# Altium project EMC2026_v2.PrjPCB
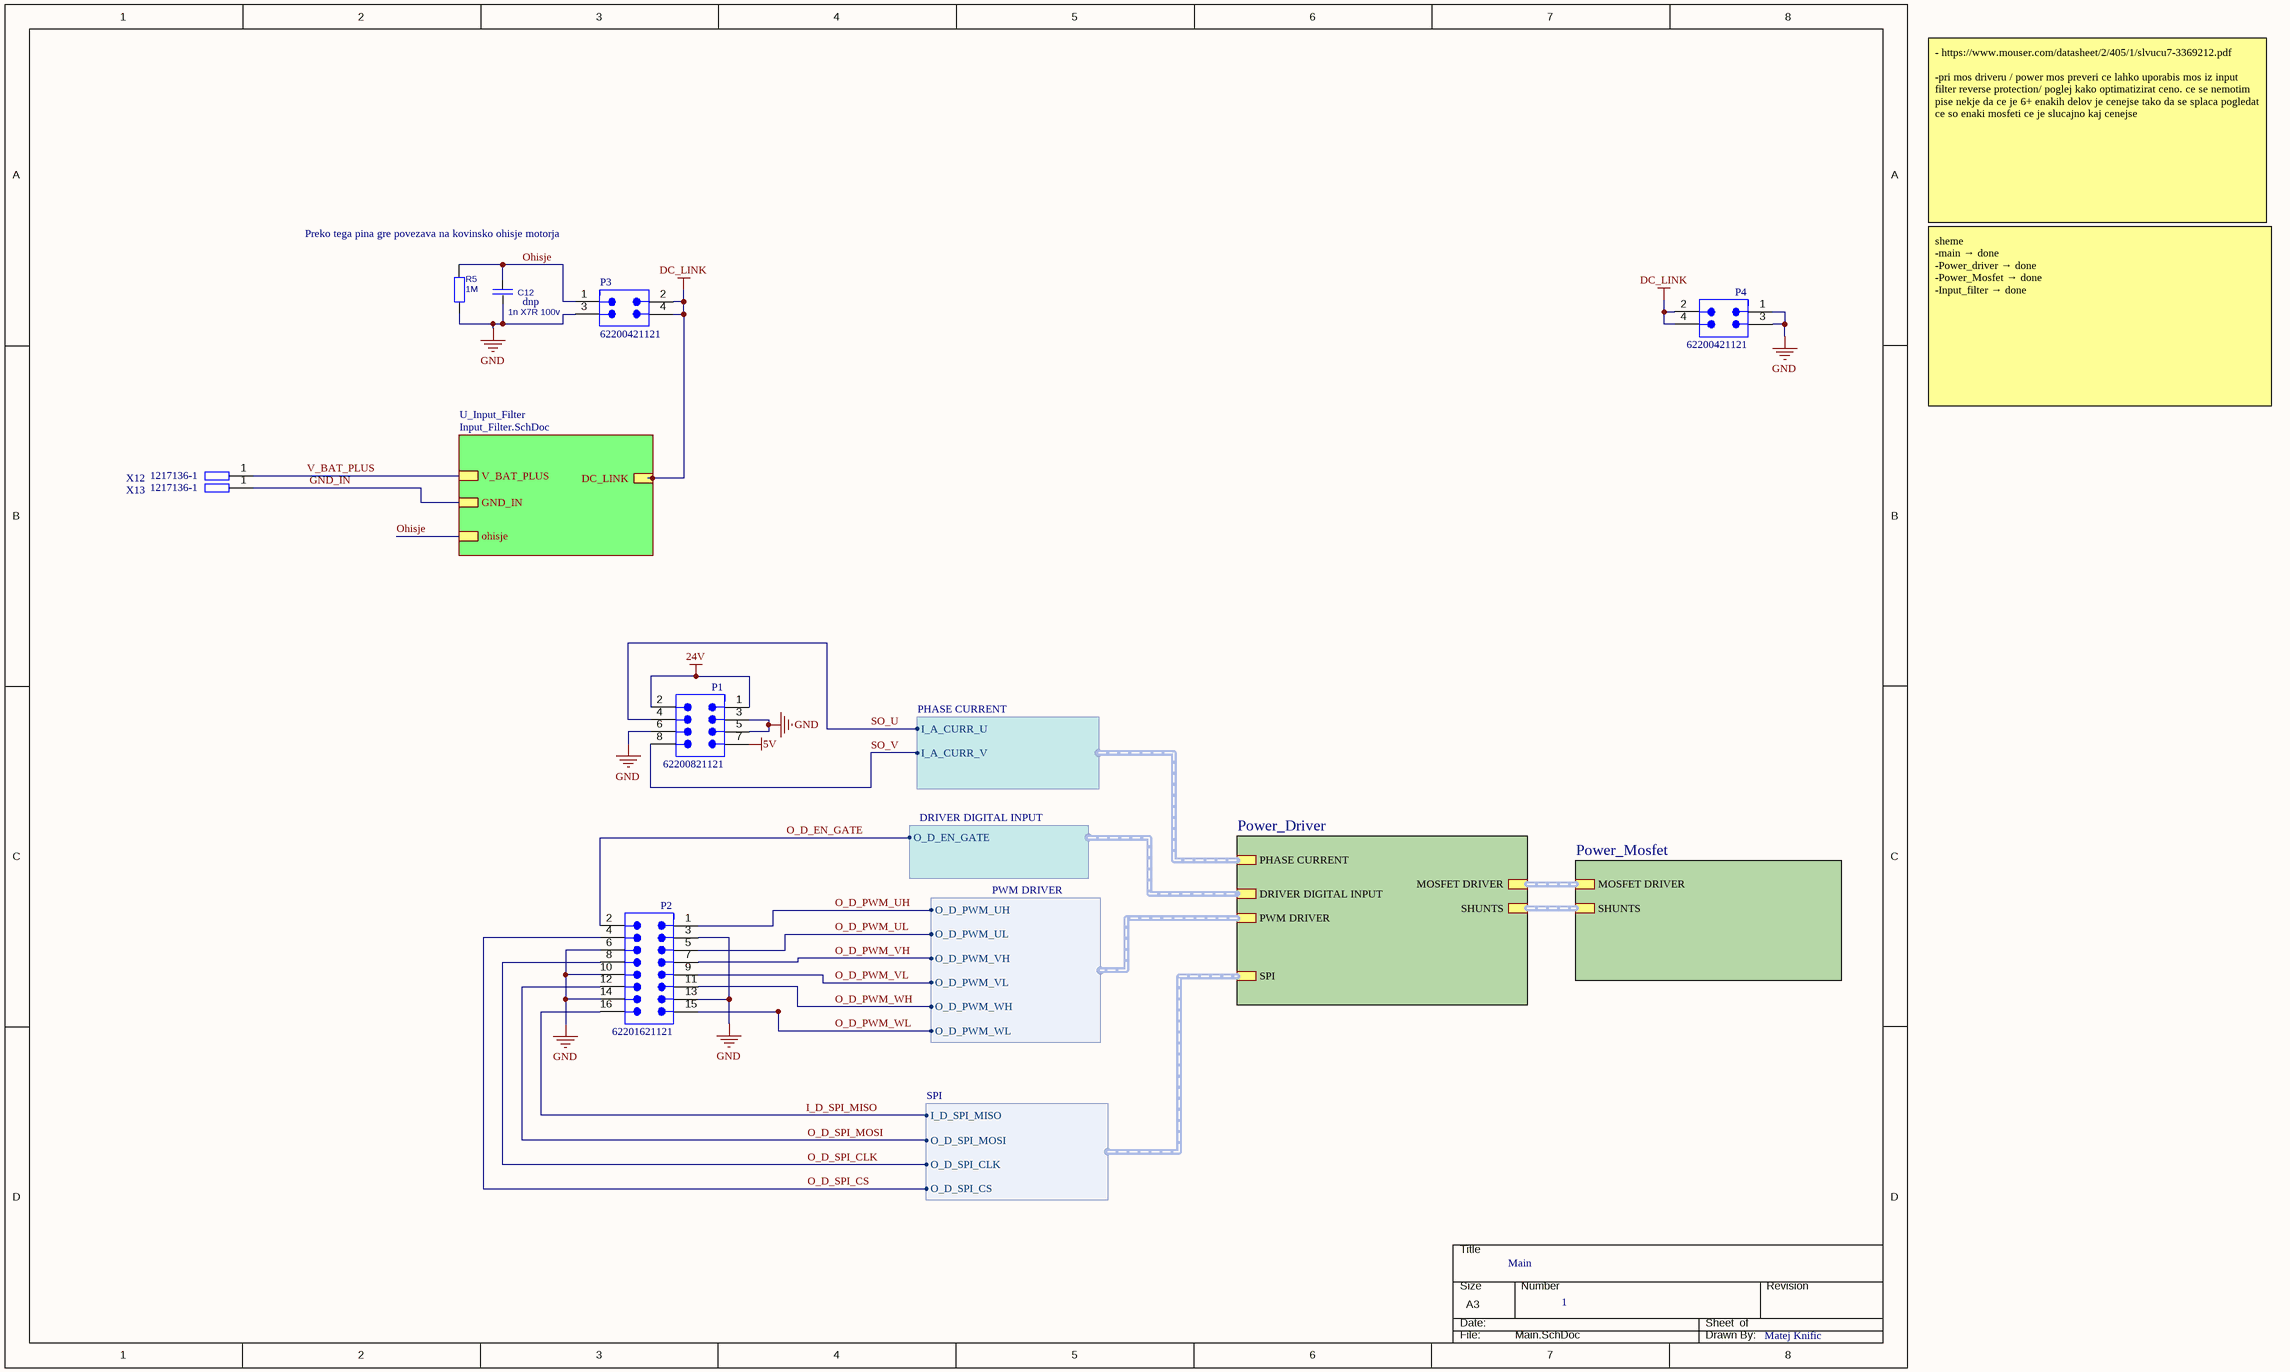
[diagram p0: Main.SchDoc]
Created: Luka Kavčič; PCB_ECN: /; PCB_ID: EMC2026; PCB_Material: FR4; PCB_Rev: 04; PCB_SAP_ID: ******; PCB_SAP_Name: VEZJE TISKANO EMC2026; PCB_Status: in progress
4 sheets, 91 parts. Net scope: hierarchical (ports join the sheet entries above them; power ports are global).
Board file: PCB_top.PcbDoc
Sheets:
  Main.SchDoc
    Power_Driver = Power_Driver.SchDoc
    Power_Mosfet = Power_Mosfet.SchDoc
    U_Input_Filter = Input_Filter.SchDoc

## Sheet Main.SchDoc
size A3; ApprovedBy: Franci Lahajnar; CheckedBy: Franci Lahajnar; Author: Ciril Močnik; DrawnBy: Ciril Močnik; Engineer: Franci Lahajnar; DocumentNumber: 1; SheetNumber: 1; SheetTotal: 12; PageSetup: Record=PageOptions|CenterHorizontal=True|CenterVertical=True|PrintScale=0.96|XCorrection=1.00|YCorrection=1.00|PrintKind=0|BorderSize=5000000|LeftOffset=0|BottomOffset=0|Orientation=2|PaperLength=1000|PaperWidth=1000|Scale=100|PaperSource=7|PrintQuality=600|MediaType=1|DitherType=10|PrintScaleMode=1|PaperKind=A4 210 x 297 mm; Sklop: SCHEMATIC; TipDok: SCHEMATIC; ModifiedDate: 2.10.2018

### Parts
C12  Parameter 1: dnp  [C0603]  (hidden comment: 1n X7R 100v)
P1  62200821121  [62200821121]
P2  62201621121  [62201621121]
P3  62200421121  [62200421121]
P4  62200421121  [62200421121]
R5  1M  [R0603]
X12  Manufacturer code: 1217136-1  [FPR_TAB_6.3_P5.08_Pokončni]  (hidden comment: C_TE_FASTON_6.3_P5.08)
X13  Manufacturer code: 1217136-1  [FPR_TAB_6.3_P5.08_Pokončni]  (hidden comment: C_TE_FASTON_6.3_P5.08)

### Sub-sheets
Power_Driver = Power_Driver.SchDoc: MOSFET DRIVER (harness MOSFET DRIVER), DRIVER DIGITAL INPUT (harness DRIVER DIGITAL INPUT), SPI (harness SPI), PHASE CURRENT (harness PHASE CURRENT), SHUNTS (harness SHUNTS), PWM DRIVER (harness PWM DRIVER)
Power_Mosfet = Power_Mosfet.SchDoc: MOSFET DRIVER (harness MOSFET DRIVER), SHUNTS (harness Shunts)
U_Input_Filter = Input_Filter.SchDoc: V_BAT_PLUS, DC_LINK, GND_IN, ohisje

### Harnesses
SPI: I_D_SPI_MISO, O_D_SPI_CLK, O_D_SPI_CS, O_D_SPI_MOSI
PWM DRIVER: O_D_PWM_UH, O_D_PWM_UL, O_D_PWM_VH, O_D_PWM_VL, O_D_PWM_WH, O_D_PWM_WL
DRIVER DIGITAL INPUT: O_D_EN_GATE
PHASE CURRENT: I_A_CURR_U, I_A_CURR_V

### Nets
5V: P1.7
24V: P1.1 P1.2
DC_LINK: P3.2 P3.4 P4.2 P4.4 ; sheet U_Input_Filter/DC_LINK
GND: C12.2 P1.3 P1.5 P1.6 P2.3 P2.6 P2.10 P2.13 P2.14 P3.3 P4.1 P4.3 R5.1
GND_IN: X13.1 ; sheet U_Input_Filter/GND_IN
I_D_SPI_MISO: P2.16 ; sheet Power_Driver/SPI.I_D_SPI_MISO
O_D_EN_GATE: P2.2 ; sheet Power_Driver/DRIVER DIGITAL INPUT.O_D_EN_GATE
O_D_PWM_UH: P2.1 ; sheet Power_Driver/PWM DRIVER.O_D_PWM_UH
O_D_PWM_UL: P2.5 ; sheet Power_Driver/PWM DRIVER.O_D_PWM_UL
O_D_PWM_VH: P2.7 ; sheet Power_Driver/PWM DRIVER.O_D_PWM_VH
O_D_PWM_VL: P2.9 ; sheet Power_Driver/PWM DRIVER.O_D_PWM_VL
O_D_PWM_WH: P2.11 ; sheet Power_Driver/PWM DRIVER.O_D_PWM_WH
O_D_PWM_WL: P2.15 ; sheet Power_Driver/PWM DRIVER.O_D_PWM_WL
O_D_SPI_CLK: P2.8 ; sheet Power_Driver/SPI.O_D_SPI_CLK
O_D_SPI_CS: P2.4 ; sheet Power_Driver/SPI.O_D_SPI_CS
O_D_SPI_MOSI: P2.12 ; sheet Power_Driver/SPI.O_D_SPI_MOSI
Ohisje: C12.1 P3.1 R5.2 ; sheet U_Input_Filter/ohisje
SO_U: P1.4 ; sheet Power_Driver/PHASE CURRENT.I_A_CURR_U
SO_V: P1.8 ; sheet Power_Driver/PHASE CURRENT.I_A_CURR_V
V_BAT_PLUS: X12.1 ; sheet U_Input_Filter/V_BAT_PLUS

### Buses and harness runs
harness sheet Power_Driver/MOSFET DRIVER = sheet Power_Mosfet/MOSFET DRIVER
harness sheet Power_Driver/SHUNTS = sheet Power_Mosfet/SHUNTS

### Notes on the sheet
- - https://www.mouser.com/datasheet/2/405/1/slvucu7-3369212.pdf
  -pri mos driveru / power mos preveri ce lahko uporabis mos iz input filter reverse protection/ poglej kako optimatizirat ceno. ce se nemotim pise nekje da ce je 6+ enakih delov je cenejse tako da se splaca pogledat ce so enaki mosfeti ce je slucajno kaj cenejse
- Preko tega pina gre povezava na kovinsko ohisje motorja
- sheme
  -main → done
  -Power_driver → done
  -Power_Mosfet → done
  -Input_filter → done
- Main
- Matej Knific
- THIS DOCUMENT AND THE DATA DISCLOSED HEREIN OR
- HEREWITH IS THE PROPERTY OF ALTIUM LIMITED AND MAY
- DWG NO:
- REVISION
- REV:
- DESCRIPTION
- DATE
- APPROVED
- BE FREELY DISTRIBUTED IN WHOLE. NO RIGHTS ARE
- RESERVED OR EXPRESS OR IMPLIED WARANTEE GIVEN.
- ENG:
- APPROVALS
- PROJECT
- DSN:
- CHK:
- REFERENCE DOCUMENTS
- PROJECT REVISION:
- TITLE
- DOCUMENT REVISION:
- DESIGN ITEM:
- BOM:
- FAB DWG:
- PCB DWG:
- ASSY DWG:
- SCALE:
- A3
- SIZE
- CAGE CODE
- FILE NAME
- DWG NO.
- SHEET
- OF
- REV

### Library data of the parts
C12 = C: Capacitor; Value: 1n X7R 100v
P1 = CMP-1502-00947-4: THT Vertical Pin Header WR-PHD, Pitch 1.27 mm, Dual Row, 8 pins; System: Connector; Row Spacing: 1.27mm; Connector Type: Male Pin; Contact Resistance: 20mΩ; Number of Contacts: 8; Current Rating: 1A; Gender: Male; Contact Plating: Gold; Packaging: Box; Termination: Solder; Number of Pins: 8; Lead Pitch: 1.27mm; Contact Material: Copper; Pitch: 1.27mm; Contact Mating Length: 3.81mm; Number of Rows: 2; RoHS: Compliant; Orientation: Vertical; Color: Black; Mount: Through Hole; Number of Positions: 8
P2 = CMP-1502-00950-4: THT Vertical Pin Header WR-PHD, Pitch 1.27 mm, Dual Row, 16 pins; Number of Positions: 16; Pitch: 1.27mm; Connector Type: Male Pin; Gender: Male; Current Rating: 1A; Contact Resistance: 20mΩ; System: Connector; RoHS: Compliant; Number of Rows: 2; Lead Pitch: 1.27mm; Contact Mating Length: 3.81mm; Row Spacing: 1.27mm; Mount: Through Hole; Number of Contacts: 16; Color: Black; Contact Material: Copper; Termination: Solder; Number of Pins: 16; Orientation: Vertical; Packaging: Box; Contact Plating: Gold
P3 P4 = CMP-1502-00946-4: THT Vertical Pin Header WR-PHD, Pitch 1.27 mm, Dual Row, 4 pins; Row Spacing: 1.27mm; Gender: Male; Number of Positions: 4; Contact Resistance: 20mΩ; Current Rating: 1A; System: Connector; Connector Type: Male Pin; Pitch: 1.27mm; Termination: Solder; Packaging: Box; Contact Mating Length: 3.81mm; Number of Pins: 4; Color: Black; Number of Contacts: 4; Contact Material: Copper; Orientation: Vertical; RoHS: Compliant; Mount: Through Hole; Lead Pitch: 1.27mm; Contact Plating: Gold; Number of Rows: 2
R5 = R: Value: 1M
X12 X13 = C_TE_FASTON_6.3_P5.08-4: FASTON 6.3 P5.08 Pokončni; Manufacturer: TE CONNECTIVITY; Voltage: /; SAP Ident: 1163972; SAP Name: KONEKTOR 1217136-1 TEC; BS: BS1552; AEC: No; Class: 15526; PinCount: 1; Datasheet: -; ROHS: 2011/65/EU; Mount: THT; REACH: 21.1.2025; TemperatureGrade: -30...110 °C; Current: -; HRVal: 1217136-1; Housing: 6.3x0.8mm; UL: /; MSL: 1

## Sheet Power_Driver.SchDoc
size A3; CheckedBy: Franci Lahajnar; DrawnBy: Ciril Močnik; DocumentNumber: 5; SheetNumber: 5; SheetTotal: 12; PageSetup: Record=PageOptions|CenterHorizontal=True|CenterVertical=True|PrintScale=0.96|XCorrection=1.00|YCorrection=1.00|PrintKind=0|BorderSize=5000000|LeftOffset=0|BottomOffset=0|Orientation=2|PaperLength=1000|PaperWidth=1000|Scale=100|PaperSource=7|PrintQuality=600|MediaType=1|DitherType=10|PaperKind=A4 210 x 297 mm|PrintScaleMode=1; Sklop: POWER DRIVER; TipDok: SCHEMATIC
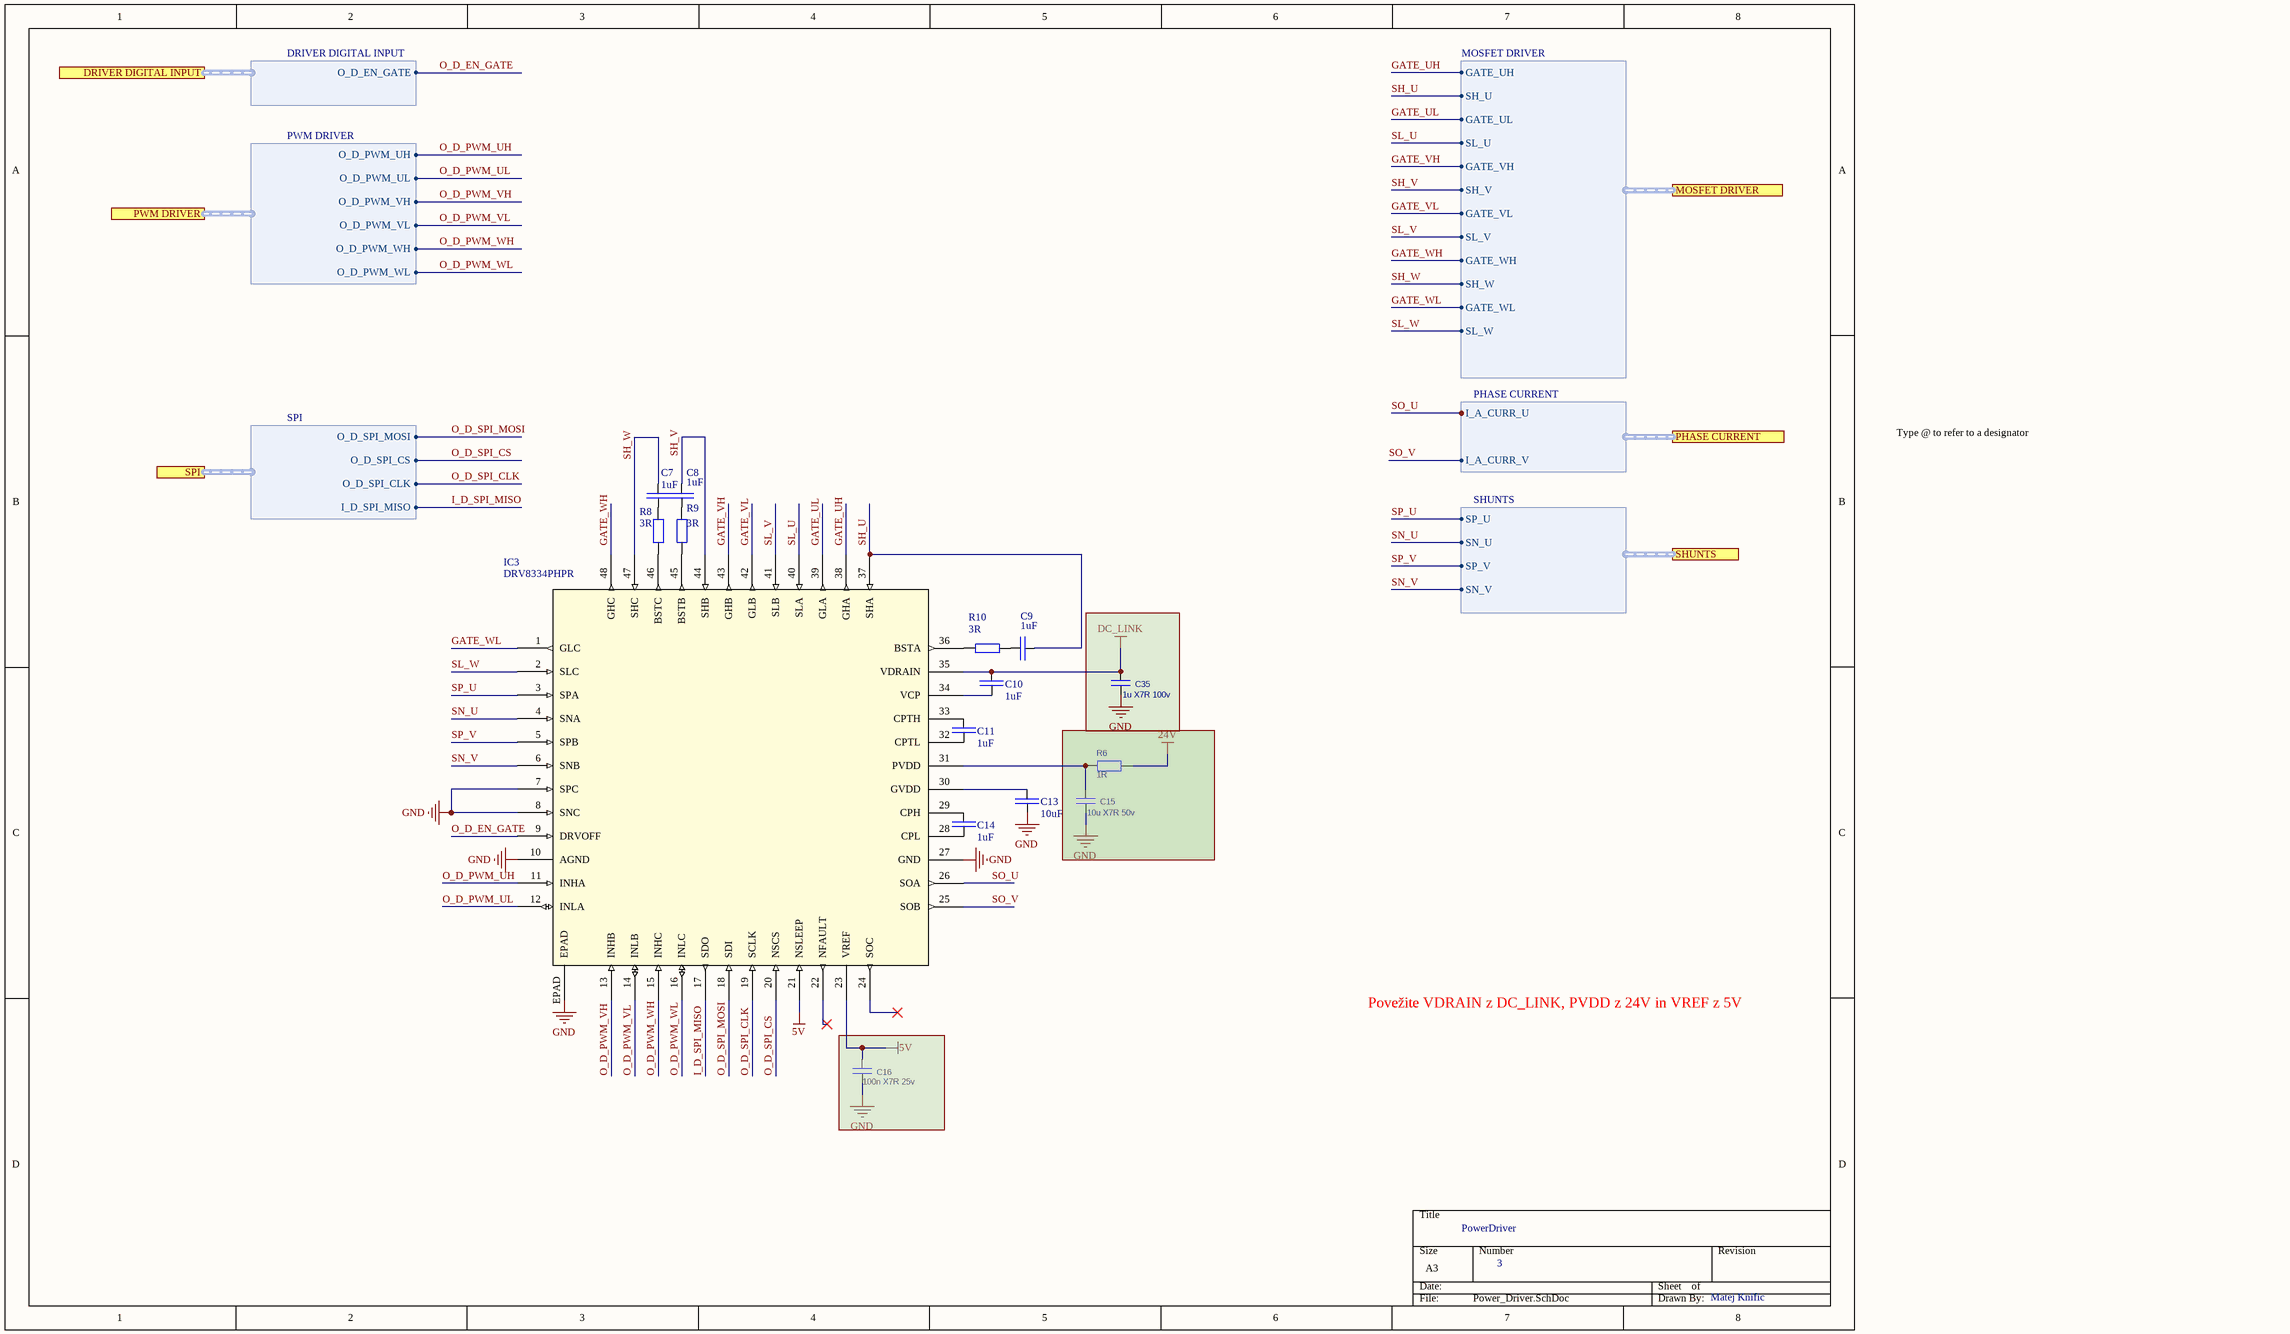
[diagram p1: Power_Driver.SchDoc]

### Parts
C7  HRVal: 1uF  [FPR_0805_C_R0_1]  (hidden comment: C_S_0805_1u_X7R_5)
C8  HRVal: 1uF  [FPR_0805_C_R0_1]  (hidden comment: C_S_0805_1u_X7R_5)
C9  HRVal: 1uF  [FPR_0805_C_R0_1]  (hidden comment: C_S_0805_1u_X7R_5)
C10  HRVal: 1uF  [FPR_0805_C_R0_1]  (hidden comment: C_S_0805_1u_X7R_5)
C11  HRVal: 1uF  [FPR_0805_C_R0_1]  (hidden comment: C_S_0805_1u_X7R_5)
C13  HRVal: 10uF  [FPR_1210_C_R0_10u]  (hidden comment: C_S_1210_10u_X7R_6)
C14  HRVal: 1uF  [FPR_0805_C_R0_1]  (hidden comment: C_S_0805_1u_X7R_5)
C15  10u X7R 50v  [RCL1210]
C16  100n X7R 25v  [C0603]
C35  1u X7R 100v  [RCL1210]
IC3  Manufacturer code: DRV8334PHPR  [FPR_HTQFP_48P]  (hidden comment: IC_D_DRV8334PHPR)
R6  1R  [R0603]
R8  HRVal: 3R  [FPR_0603_R_R0_1]  (hidden comment: R_L_0603_3R_1%_1)
R9  HRVal: 3R  [FPR_0603_R_R0_1]  (hidden comment: R_L_0603_3R_1%_1)
R10  HRVal: 3R  [FPR_0603_R_R0_1]  (hidden comment: R_L_0603_3R_1%_1)

### Ports
DRIVER DIGITAL INPUT (harness DRIVER DIGITAL INPUT), MOSFET DRIVER (harness MOSFET DRIVER), PHASE CURRENT (harness PHASE CURRENT), PWM DRIVER (harness PWM DRIVER), SHUNTS (harness SHUNTS), SPI (harness SPI)

### Harnesses
DRIVER DIGITAL INPUT: O_D_EN_GATE
PWM DRIVER: O_D_PWM_UH, O_D_PWM_UL, O_D_PWM_VH, O_D_PWM_VL, O_D_PWM_WH, O_D_PWM_WL
SPI: I_D_SPI_MISO, O_D_SPI_CLK, O_D_SPI_CS, O_D_SPI_MOSI
MOSFET DRIVER: GATE_UH, GATE_UL, GATE_VH, GATE_VL, GATE_WH, GATE_WL, SH_U, SH_V, SH_W, SL_U, SL_V, SL_W
PHASE CURRENT: I_A_CURR_U, I_A_CURR_V
SHUNTS: SP_U, SN_U, SP_V, SN_V

### Nets
5V: C16.1 IC3.21(NSLEEP) IC3.23(VREF)
24V: R6.1
DC_LINK: C10.1 C35.1 IC3.35(VDRAIN)
GND: C13.1 C15.2 C16.2 C35.2 IC3.7(SPC) IC3.8(SNC) IC3.10(AGND) IC3.27(GND) IC3.EPAD
GATE_UH: IC3.38(GHA) ; port MOSFET DRIVER.GATE_UH
GATE_UL: IC3.39(GLA) ; port MOSFET DRIVER.GATE_UL
GATE_VH: IC3.43(GHB) ; port MOSFET DRIVER.GATE_VH
GATE_VL: IC3.42(GLB) ; port MOSFET DRIVER.GATE_VL
GATE_WH: IC3.48(GHC) ; port MOSFET DRIVER.GATE_WH
GATE_WL: IC3.1(GLC) ; port MOSFET DRIVER.GATE_WL
I_D_SPI_MISO: IC3.17(SDO) ; port SPI.I_D_SPI_MISO
O_D_EN_GATE: IC3.9(DRVOFF) ; port DRIVER DIGITAL INPUT.O_D_EN_GATE
O_D_PWM_UH: IC3.11(INHA) ; port PWM DRIVER.O_D_PWM_UH
O_D_PWM_UL: IC3.12(INLA) ; port PWM DRIVER.O_D_PWM_UL
O_D_PWM_VH: IC3.13(INHB) ; port PWM DRIVER.O_D_PWM_VH
O_D_PWM_VL: IC3.14(INLB) ; port PWM DRIVER.O_D_PWM_VL
O_D_PWM_WH: IC3.15(INHC) ; port PWM DRIVER.O_D_PWM_WH
O_D_PWM_WL: IC3.16(INLC) ; port PWM DRIVER.O_D_PWM_WL
O_D_SPI_CLK: IC3.19(SCLK) ; port SPI.O_D_SPI_CLK
O_D_SPI_CS: IC3.20(NSCS) ; port SPI.O_D_SPI_CS
O_D_SPI_MOSI: IC3.18(SDI) ; port SPI.O_D_SPI_MOSI
SH_U: C9.2 IC3.37(SHA) ; port MOSFET DRIVER.SH_U
SH_V: C8.2 IC3.44(SHB) ; port MOSFET DRIVER.SH_V
SH_W: C7.2 IC3.47(SHC) ; port MOSFET DRIVER.SH_W
SL_U: IC3.40(SLA) ; port MOSFET DRIVER.SL_U
SL_V: IC3.41(SLB) ; port MOSFET DRIVER.SL_V
SL_W: IC3.2(SLC) ; port MOSFET DRIVER.SL_W
SN_U: IC3.4(SNA) ; port SHUNTS.SN_U
SN_V: IC3.6(SNB) ; port SHUNTS.SN_V
SO_U: IC3.26(SOA) ; port PHASE CURRENT.I_A_CURR_U
SO_V: IC3.25(SOB) ; port PHASE CURRENT.I_A_CURR_V
SP_U: IC3.3(SPA) ; port SHUNTS.SP_U
SP_V: IC3.5(SPB) ; port SHUNTS.SP_V
NetC7_1: C7.1 R8.2
NetC8_1: C8.1 R9.2
NetC9_1: C9.1 R10.2
NetC10_2: C10.2 IC3.34(VCP)
NetC11_1: C11.1 IC3.33(CPTH)
NetC11_2: C11.2 IC3.32(CPTL)
NetC13_2: C13.2 IC3.30(GVDD)
NetC14_1: C14.1 IC3.29(CPH)
NetC14_2: C14.2 IC3.28(CPL)
NetC15_1: C15.1 IC3.31(PVDD) R6.2
NetIC3_36: IC3.36(BSTA) R10.1
NetIC3_45: IC3.45(BSTB) R9.1
NetIC3_46: IC3.46(BSTC) R8.1

Not connected (* = marked no-connect by the designer): IC3 22(NFAULT)* 24(SOC)*

### Notes on the sheet
- Type @ to refer to a designator
- Povežite VDRAIN z DC_LINK, PVDD z 24V in VREF z 5V
- PowerDriver
- 3
- Matej Knific
- Kolektor Group d.o.o.
- KOLEKTOR
- GROUP
- Datum:
- Konst.:
- Naziv
- Sklop
- ECN
- SAP ID
- Rev.:
- List:
- Vojkova 10, p.p. 85
- SI-5280 Idrija , Slovenija
- Koda
- Datoteka:

### Library data of the parts
C7-C11 C14 = C_S_0805_1u_X7R_5-3: Single capacitor 1uF 10% soft-term AEC200; Manufacturer: Murata; Manufacturer code: GCJ21BR71H105KA01L; SAP Name: KONDENZATOR GCJ21BR71H105KA01L MUR; BS: BS1556; Tolerance: 10; Value [F]: 1e-6; Voltage: 50; SAP Ident: 927197; Class: 15562; Mount: SMD; ROHS: 2011/65/EU; Datasheet: https://www.murata.com/~/media/webrenewal/support/library/catalog/products/capacitor/mlcc/c03e.ashx; TemperatureGrade: -55...125; Housing: 0805; AEC: 21.8.2019; REACH: 20.6.2016; UL: -; MSL: 1
C13 = C_S_1210_10u_X7R_6-4: Single capacitor 10uF; Manufacturer: AVX; Manufacturer code: 12105C106K4Z4A; BS: BS1556; SAP Name: KONDENZATOR 12105C106K4Z4A AVX; Tolerance: 10; Value [F]: 10e-6; Voltage: 50; SAP Ident: 919177; Class: 15562; Shelf life: 12 months; ROHS: 2011/65/EU; AEC: 3.6.2019; TemperatureGrade: -55...125; MSL: /; UL: -; Housing: 1210; Datasheet: /; Mount: SMD; REACH: 15.1.2019
C15 C16 C35 = C: Capacitor
  C15: Value: 10u X7R 50v
  C16: Value: 100n X7R 25v
  C35: Value: 1u X7R 100v
IC3 = IC_D_DRV8334PHPR-3: Three phase MOSFET driver; Manufacturer: TI; AEC: No; BS: BS1557; Class: 15571; Output Current: 1000 / 2000 mA; Output Voltage: 60; SAP Ident: 1125019; SAP Name: GONILNIK DRV8334PHPR TI; Datasheet: /; Housing: HTQFP; HRVal: DRV8334PHPR; Mount: SMD; REACH: 23.07.2024; ROHS: 2011/65/EU; TemperatureGrade: -40...125; UL: -; MSL: 1
R6 = R: Value: 1R
R8-R10 = R_L_0603_3R_1%_1-3: Upor 3R 0603 1% 100mW; Manufacturer code: CRCW06033R00FKEA; Manufacturer: VISHAY; SAP Name: UPOR CRCW06033R00FKEA VIS; Tolerance: 1; Power: 100e-3; ReleaseDateNum: 45455.4806185648; BS: BS1556; Class: 15561; Value [Ohm]: 3; SAP Ident: 1125027; Housing: 0603; TemperatureGrade: -55...155; Mount: SMD; ROHS: 2015/863/EU; Datasheet: https://www.vishay.com/docs/20035/dcrcwe3.pdf; AEC: 11.6.2024; REACH: 23.1.2024; UL: 1; MSL: 1

## Sheet Power_Mosfet.SchDoc
size A3; ApprovedBy: Franci lahajnar; DrawnBy: Ciril Močnik; DocumentNumber: 7; SheetNumber: 7; SheetTotal: 12; PageSetup: Record=PageOptions|CenterHorizontal=True|CenterVertical=True|PrintScale=0.96|XCorrection=1.00|YCorrection=1.00|PrintKind=0|BorderSize=5000000|LeftOffset=0|BottomOffset=0|Orientation=2|PaperLength=1000|PaperWidth=1000|Scale=100|PaperSource=7|PrintQuality=600|MediaType=1|DitherType=10|PaperKind=A4 210 x 297 mm|PrintScaleMode=1; Sklop: POWER MOSFET BRIDGE; TipDok: SCHEMATIC
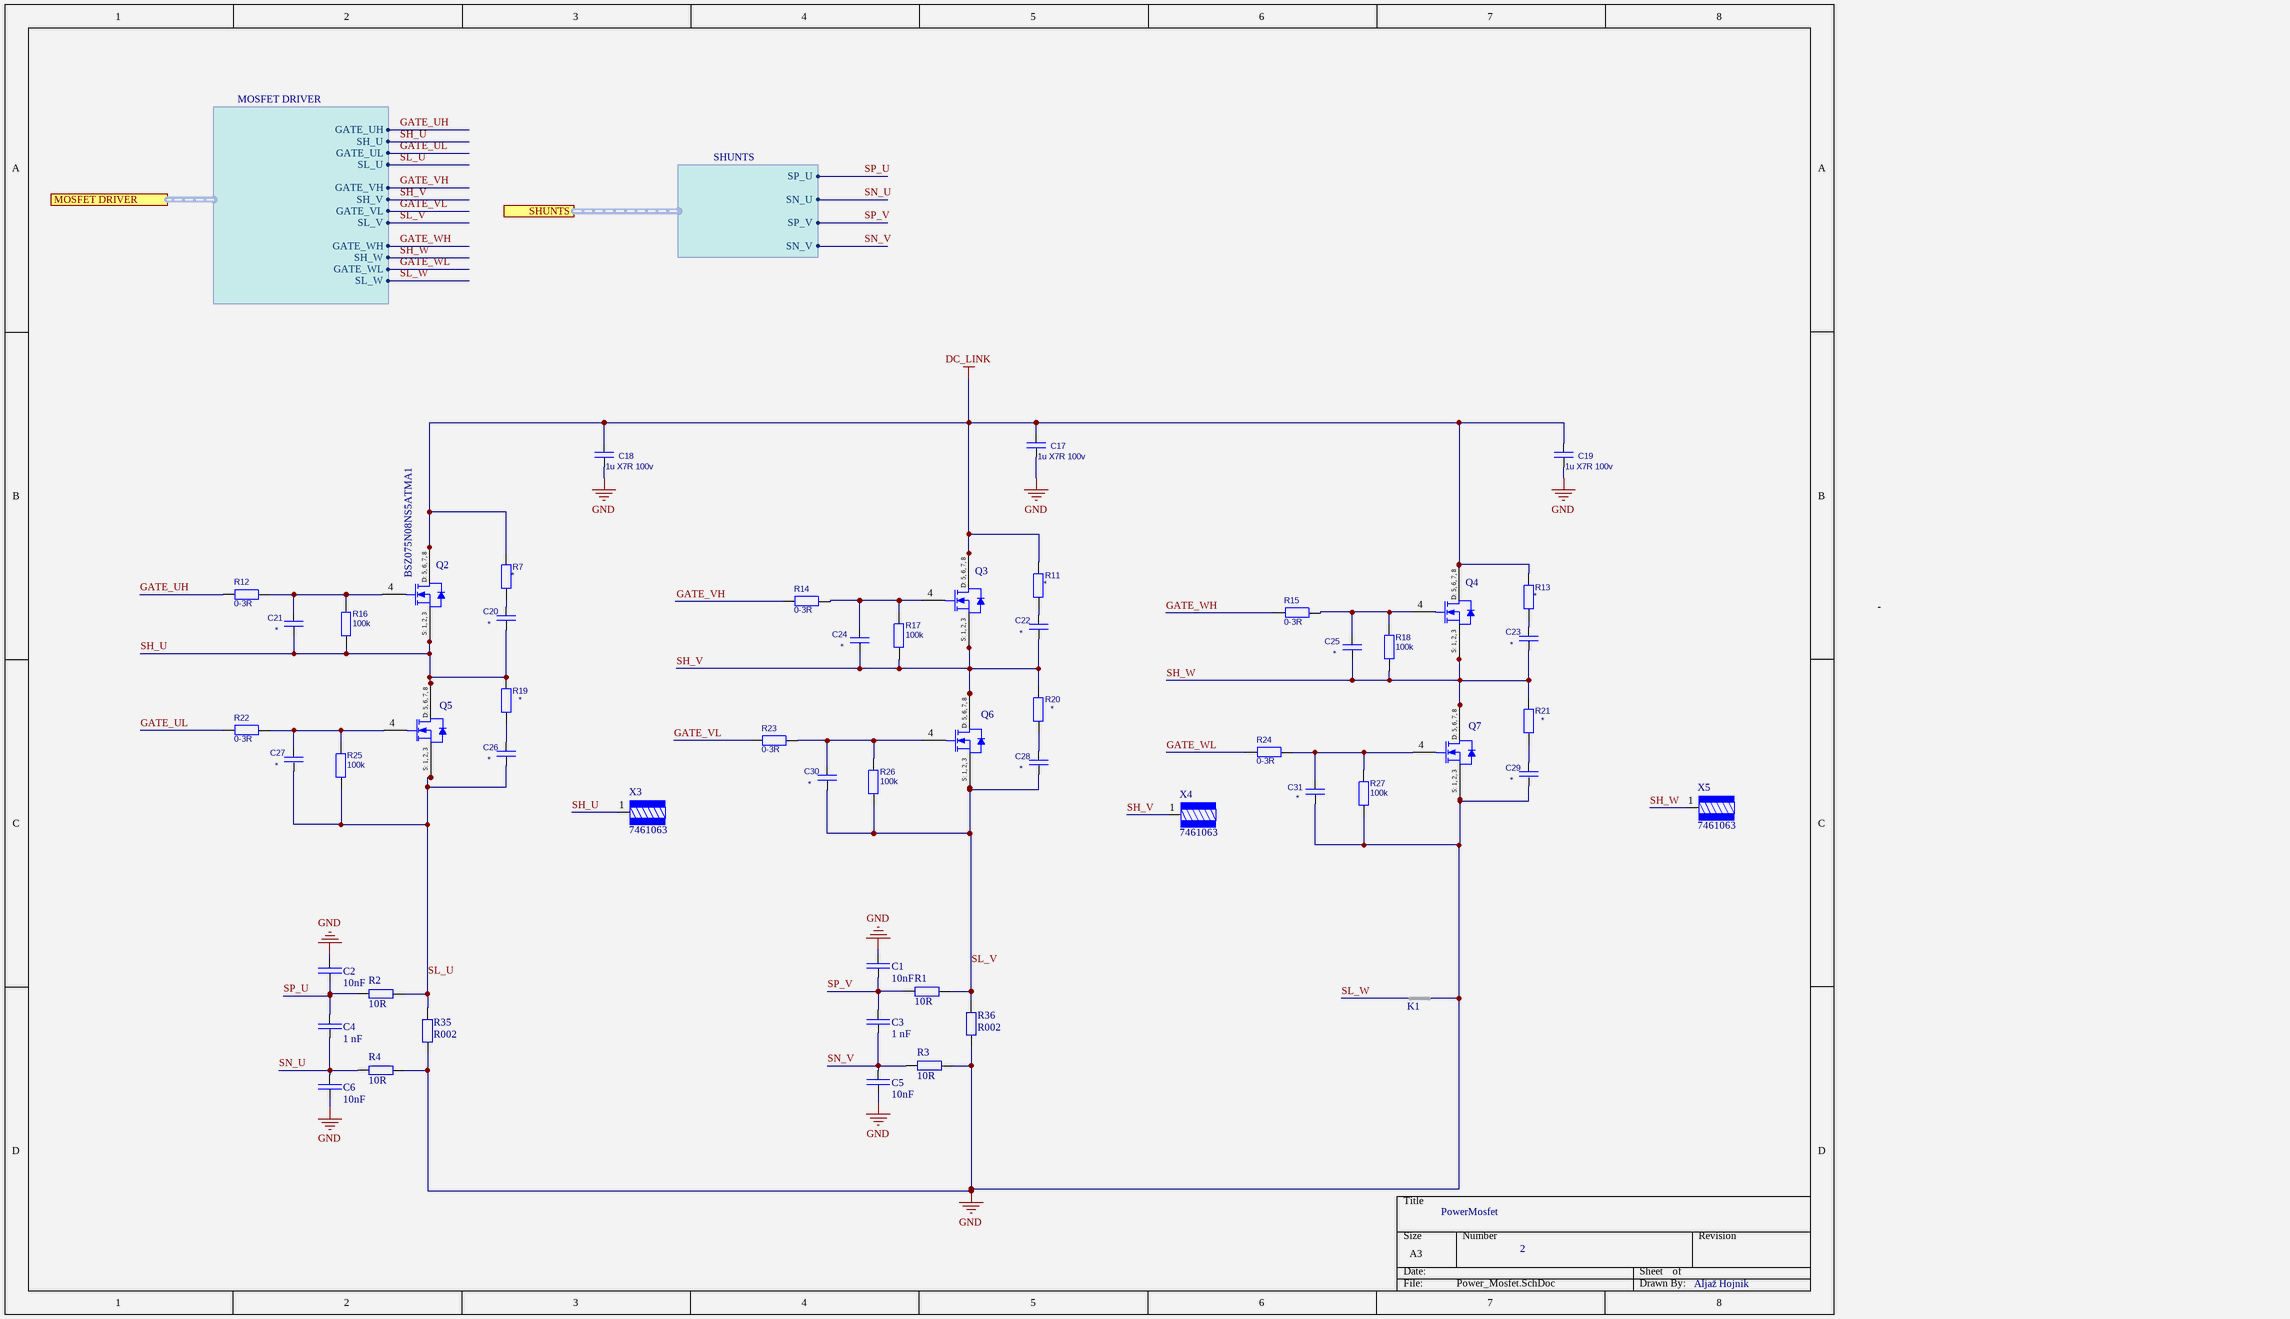
[diagram p2: Power_Mosfet.SchDoc]

### Parts
C1  HRVal: 10nF  [FPR_0603_C_R0]  (hidden comment: C_S_0603_10n_X7R)
C2  HRVal: 10nF  [FPR_0603_C_R0]  (hidden comment: C_S_0603_10n_X7R)
C3  HRVal: 1 nF  [FPR_0603_C_R0]  (hidden comment: C_S_0603_1nF_X7R_3)
C4  HRVal: 1 nF  [FPR_0603_C_R0]  (hidden comment: C_S_0603_1nF_X7R_3)
C5  HRVal: 10nF  [FPR_0603_C_R0]  (hidden comment: C_S_0603_10n_X7R)
C6  HRVal: 10nF  [FPR_0603_C_R0]  (hidden comment: C_S_0603_10n_X7R)
C17  1u X7R 100v  [RCL1210]
C18  1u X7R 100v  [RCL1210]
C19  1u X7R 100v  [RCL1210]
C20  *  [C0603]
C21  *  [C0603]
C22  *  [C0603]
C23  *  [C0603]
C24  *  [C0603]
C25  *  [C0603]
C26  *  [C0603]
C27  *  [C0603]
C28  *  [C0603]
C29  *  [C0603]
C30  *  [C0603]
C31  *  [C0603]
K1  NetTie  [FPR_NETTIE_0_3]  (value not drawn)  (net tie, no BOM)
Q2  BSZ075N08NS5ATMA1  [BSZ075N08NS5ATMA1]
Q3  BSZ075N08NS5ATMA1  [BSZ075N08NS5ATMA1]  (value not drawn)
Q4  BSZ075N08NS5ATMA1  [BSZ075N08NS5ATMA1]  (value not drawn)
Q5  BSZ075N08NS5ATMA1  [BSZ075N08NS5ATMA1]  (value not drawn)
Q6  BSZ075N08NS5ATMA1  [BSZ075N08NS5ATMA1]  (value not drawn)
Q7  BSZ075N08NS5ATMA1  [BSZ075N08NS5ATMA1]  (value not drawn)
R1  HRVal: 10R  [FPR_0603_R_R0]  (hidden comment: R_L_0603_10R_1%)
R2  HRVal: 10R  [FPR_0603_R_R0]  (hidden comment: R_L_0603_10R_1%)
R3  HRVal: 10R  [FPR_0603_R_R0]  (hidden comment: R_L_0603_10R_1%)
R4  HRVal: 10R  [FPR_0603_R_R0]  (hidden comment: R_L_0603_10R_1%)
R7  *  [R0603]
R11  *  [R0603]
R12  0-3R  [R0603]
R13  *  [R0603]
R14  0-3R  [R0603]
R15  0-3R  [R0603]
R16  100k  [R0603]
R17  100k  [R0603]
R18  100k  [R0603]
R19  *  [R0603]
R20  *  [R0603]
R21  *  [R0603]
R22  0-3R  [R0603]
R23  0-3R  [R0603]
R24  0-3R  [R0603]
R25  100k  [R0603]
R26  100k  [R0603]
R27  100k  [R0603]
R35  HRVal: R002  [FPR_2512_R_R1]  (hidden comment: R_L_2512_0R002_1%_4)
R36  HRVal: R002  [FPR_2512_R_R1]  (hidden comment: R_L_2512_0R002_1%_4)
X3  Manufacturer code: 7461063  [FPR_K_1P_WURTH]  (hidden comment: K_WURTH_7461063)
X4  Manufacturer code: 7461063  [FPR_K_1P_WURTH]  (hidden comment: K_WURTH_7461063)
X5  Manufacturer code: 7461063  [FPR_K_1P_WURTH]  (hidden comment: K_WURTH_7461063)

### Ports
MOSFET DRIVER (harness MOSFET DRIVER), SHUNTS (harness Shunts)

### Harnesses
SHUNTS: SP_U, SN_U, SP_V, SN_V
MOSFET DRIVER: GATE_UH, GATE_UL, GATE_VH, GATE_VL, GATE_WH, GATE_WL, SH_U, SL_U, SH_V, SL_V, SH_W, SL_W

### Nets
DC_LINK: C17.1 C18.1 C19.1 Q2.5(D) Q2.6(D) Q2.7(D) Q2.8(D) Q2.9(D) Q3.5(D) Q3.6(D) Q3.7(D) Q3.8(D) Q3.9(D) Q4.5(D) Q4.6(D) Q4.7(D) Q4.8(D) Q4.9(D) R7.1 R11.1 R13.1
GND: C1.2 C2.2 C5.1 C6.1 C17.2 C18.2 C19.2 C29.2 C31.2 K1.1 Q7.1(S) Q7.2(S) Q7.3(S) Q7.10(S) R3.2 R4.2 R27.2 R35.1 R36.1
GATE_UH: R12.1 ; port MOSFET DRIVER.GATE_UH
GATE_UL: R22.1 ; port MOSFET DRIVER.GATE_UL
GATE_VH: R14.1 ; port MOSFET DRIVER.GATE_VH
GATE_VL: R23.1 ; port MOSFET DRIVER.GATE_VL
GATE_WH: R15.1 ; port MOSFET DRIVER.GATE_WH
GATE_WL: R24.1 ; port MOSFET DRIVER.GATE_WL
SH_U: C20.2 C21.2 Q2.1(S) Q2.2(S) Q2.3(S) Q2.10(S) Q5.5(D) Q5.6(D) Q5.7(D) Q5.8(D) Q5.9(D) R16.2 R19.1 X3.1 ; port MOSFET DRIVER.SH_U
SH_V: C22.2 C24.2 Q3.1(S) Q3.2(S) Q3.3(S) Q3.10(S) Q6.5(D) Q6.6(D) Q6.7(D) Q6.8(D) Q6.9(D) R17.2 R20.1 X4.1 ; port MOSFET DRIVER.SH_V
SH_W: C23.2 C25.2 Q4.1(S) Q4.2(S) Q4.3(S) Q4.10(S) Q7.5(D) Q7.6(D) Q7.7(D) Q7.8(D) Q7.9(D) R18.2 R21.1 X5.1 ; port MOSFET DRIVER.SH_W
SL_U: C26.2 C27.2 Q5.1(S) Q5.2(S) Q5.3(S) Q5.10(S) R2.2 R25.2 R35.2 ; port MOSFET DRIVER.SL_U
SL_V: C28.2 C30.2 Q6.1(S) Q6.2(S) Q6.3(S) Q6.10(S) R1.2 R26.2 R36.2 ; port MOSFET DRIVER.SL_V
SL_W: K1.2 ; port MOSFET DRIVER.SL_W
SN_U: C4.1 C6.2 R4.1 ; port SHUNTS.SN_U
SN_V: C3.1 C5.2 R3.1 ; port SHUNTS.SN_V
SP_U: C2.1 C4.2 R2.1 ; port SHUNTS.SP_U
SP_V: C1.1 C3.2 R1.1 ; port SHUNTS.SP_V
NetC20_1: C20.1 R7.2
NetC21_1: C21.1 Q2.4(G) R12.2 R16.1
NetC22_1: C22.1 R11.2
NetC23_1: C23.1 R13.2
NetC24_1: C24.1 Q3.4(G) R14.2 R17.1
NetC25_1: C25.1 Q4.4(G) R15.2 R18.1
NetC26_1: C26.1 R19.2
NetC27_1: C27.1 Q5.4(G) R22.2 R25.1
NetC28_1: C28.1 R20.2
NetC29_1: C29.1 R21.2
NetC30_1: C30.1 Q6.4(G) R23.2 R26.1
NetC31_1: C31.1 Q7.4(G) R24.2 R27.1

### Notes on the sheet
- -
- PowerMosfet
- 2
- Aljaž Hojnik
- Kolektor Group d.o.o.
- KOLEKTOR
- GROUP
- Datum:
- Konst.:
- Naziv
- Sklop
- ECN
- SAP ID
- Rev.:
- List:
- Vojkova 10, p.p. 85
- SI-5280 Idrija , Slovenija
- Koda
- Datoteka:
- (in symbol BSZ075N08NS5ATMA1) D: 5, 6, 7, 8; S: 1, 2, 3

### Library data of the parts
C1 C2 C5 C6 = C_S_0603_10n_X7R-10: Single capacitor 10 nF; Manufacturer code: 06035C103K4Z4A; Manufacturer: AVX; SAP Name: KONDENZATOR 06035C103K4Z4A AVX; Voltage: 50; BS: BS1556; Class: 15562; Tolerance: 10; Value [F]: 10e-9; SAP Ident: 628870; REACH: 12.1.2017; MSL: 1; Mount: SMD; AEC: 16.6.2015; ROHS: 2011/65/EU; TemperatureGrade: -55...125; Datasheet: /; Housing: 0603; UL: -
C3 C4 = C_S_0603_1nF_X7R_3-1: Single capacitor 1nF 5% AEC; Manufacturer code: VJ0603Y102JXAAC; Manufacturer: VISHAY; Tolerance: 5; SAP Name: KONDENZATOR VJ0603Y102JXAAC VIS; Value [F]: 1e-9; Voltage: 50; BS: BS1556; Class: 15562; REACH: 15.1.2019; ROHS: 2011/65/EU; Datasheet: https://eu.mouser.com/datasheet/2/427/vjcommercialseries-222796.pdf; Mount: SMD; AEC: 11.2.2018; Housing: 0603; UL: -; TemperatureGrade: -55...150
C17-C31 = C: Capacitor
  C17-C19: Value: 1u X7R 100v
  C20-C31: Value: *
K1 = NetTie-10: Net tie; ItemName: NetTie; Mount: THT
R1-R4 = R_L_0603_10R_1%-18: Upor 10R 0603 1% 100mW; Manufacturer: ASJ; Manufacturer code: CR16-10R0-FY; Class: 15561; BS: BS1556; Shelf life: 12 months; SAP Name: UPOR CR16-10R0-FY ASJ; SAP Ident: 220173; Tolerance: 1; Power: 100e-3; Value [Ohm]: 10; ROHS: 2011/65/EU; Housing: 0603; Mount: SMD; TemperatureGrade: -40…155; REACH: 14.06.2023; UL: -; MSL: 1; Datasheet: https://www.asj.com.sg/pdfs/specs/1.0%20DS_General%20Thick%20Film%20Chip%20Resistor_19052017.pdf; AEC: 16.7.2015
R7 R11-R27 = R
  R7 R11 R13 R19-R21: Value: *
  R12 R14 R15 R22-R24: Value: 0-3R
  R16-R18 R25-R27: Value: 100k
R35 R36 = R_L_2512_0R002_1%_4-1: Upor 0R002 2512 1% AEC; Manufacturer code: WSLF25122L000FEA; Manufacturer: VISHAY; SAP Name: UPOR WSLF25122L000FEA VIS; Cat1: 2512; Value [Ohm]: 2e-3; Power: 5; Class: 15561; Tolerance: 1; Shelf life: 24mo; SAP Ident: ******; BS: BS1556; AEC: 19.6.2017; FootprintDescription1: SMD resistor 2512 Reflow; FootprintRevisionID1: FPR_2512_R_R1-1; Mount: SMD; UL: -; Latest_Revision: 1; Housing: 2512; REACH: 27.06.2024; TemperatureGrade: -65...170; MSL: 1; Created_At: 19.12.2025 09:12:15 AM; FootprintName1: FPR_2512_R_R1; ROHS: 2011/65/EU; Datasheet: /
X3-X5 = K_WURTH_7461063-4: Connector POWER Wurth 7461063; Manufacturer: WURTH ELEKTRONIK; UL: /; MaxCurrent: 160; AEC: No; Class: 15526; ReleaseDateNum: 45705.4409943981; Voltage: 300; BS: BS1552; SAP Name: KONEKTOR 7461063 WUE; SAP Ident: 1144983; MSL: 1; Mount: THT; TemperatureGrade: -40...150; ItemName: K_WURTH_7461063; Datasheet: /; Current: 160; REACH: 23.07.2024; HRVal: 7461063; PinCount: 1; Terminal pitch: /; Housing: THT; ROHS: 2011/65/EU
Q2-Q7 = BSZ075N08NS5ATMA1: ComponentLink1Description: Mouser; ComponentLink1URL: https://eu.mouser.com/ProductDetail/Infineon-Technologies/BSZ075N08NS5ATMA1?qs=3Bi3m9r5MQbCecwbz%252BCetA%3D%3D; ComponentLink2Description: Octopart; ComponentLink2URL: https://octopart.com/part/infineon/BSZ075N08NS5ATMA1

## Sheet Input_Filter.SchDoc
size A4
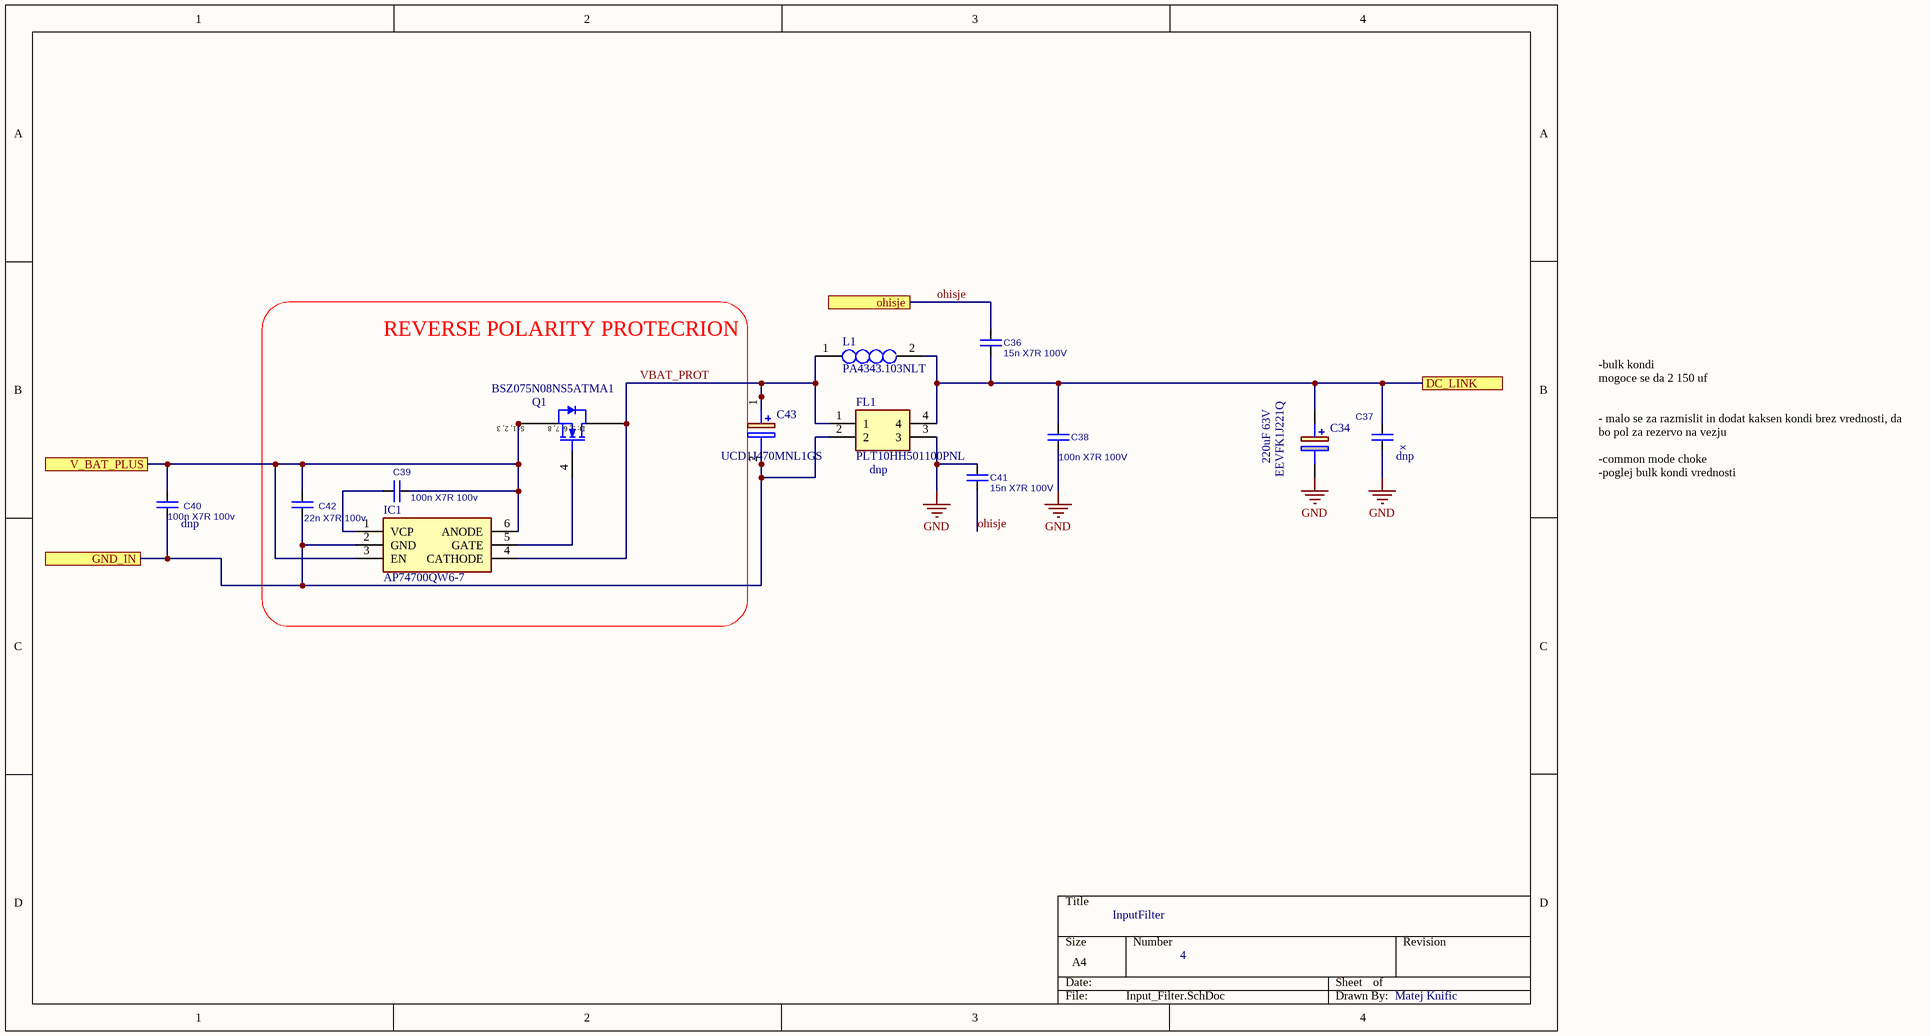
[diagram p3: Input_Filter.SchDoc]

### Parts
C34  EEVFK1J221Q  vrednost: 220uF 63V  [EEEFK0J332AQ]
C36  15n X7R 100V  [C0603]
C37  Parameter 1: dnp  [C0603]  (hidden comment: x)
C38  100n X7R 100V  [C0603]
C39  100n X7R 100v  [C0603]
C40  Parameter 1: dnp  [C0603]  (hidden comment: 100n X7R 100v)
C41  15n X7R 100V  [C0603]
C42  22n X7R 100v  [C0603]
C43  UCD1J470MNL1GS  [EEETC1V470P]
FL1  PLT10HH501100PNL  Parameter 1: dnp  [PLT10HH101150PNL]
IC1  AP74700QW6-7  [SOT95P285X140-6N]
L1  PA4343.103NLT  [PA4343103NLT]
Q1  BSZ075N08NS5ATMA1  [BSZ075N08NS5ATMA1]

### Blocks framed on the sheet
REVERSE POLARITY PROTECRION: C39 C42 IC1 Q1

### Ports
DC_LINK, GND_IN, ohisje, V_BAT_PLUS

### Nets
DC_LINK: C34.1(+) C36.2 C37.1 C38.1 FL1.4 L1.2 ; port DC_LINK
GND: C34.2(-) C37.2 C38.2 C41.1 FL1.3
GND_IN: C40.2 C42.2 C43.2(-) FL1.2 IC1.2(GND) ; port GND_IN
Ohisje: C36.1 C41.2 ; port ohisje
V_BAT_PLUS: C39.1 C40.1 C42.1 IC1.3(EN) IC1.6(ANODE) Q1.1(S) Q1.2(S) Q1.3(S) Q1.10(S) ; port V_BAT_PLUS
VBAT_PROT: C43.1(+) FL1.1 IC1.4(CATHODE) L1.1 Q1.5(D) Q1.6(D) Q1.7(D) Q1.8(D) Q1.9(D)
NetC39_2: C39.2 IC1.1(VCP)
NetIC1_5: IC1.5(GATE) Q1.4(G)

### Notes on the sheet
- -bulk kondi
  mogoce se da 2 150 uf
  - malo se za razmislit in dodat kaksen kondi brez vrednosti, da bo pol za rezervo na vezju
  -common mode choke
  -poglej bulk kondi vrednosti
- InputFilter
- 4
- Matej Knific
- (in symbol BSZ075N08NS5ATMA1) S: 1, 2, 3; D: 5, 6, 7, 8

### Library data of the parts
C34 = EEVFK1J221Q: Panasonic Aluminium Electrolytic Capacitor 220uF 63V dc 12.5mm Surface Mount FK SMD Series +105C; Geometry.Height: 15mm; Manufacturer_Name: Panasonic; Manufacturer_Part_Number: EEVFK1J221Q; Mouser Part Number: *; Mouser Price/Stock: *; Arrow Part Number: *; Arrow Price/Stock: *; Datasheet Link: http://industrial.panasonic.com/cdbs/www-data/pdf/RDE0000/ABA0000C1181.pdf
C36-C42 = C: Capacitor
  C36 C41: Value: 15n X7R 100V
  C37: Value: x
  C38: Value: 100n X7R 100V
  C39 C40: Value: 100n X7R 100v
  C42: Value: 22n X7R 100v
C43 = EEE-FK1J470L: Capacitor Polarised / UCD1J470MNL1GS!!!!; Manufacturer_Part_Number: UCD1J470MNL1GS
FL1 = PLT10HH501100PNL: Filter; Manufacturer_Name: Murata Electronics; Datasheet Link: https://www.murata.com/en-us/products/productdetail?partno=PLT10HH501100PN%23; Height: 9.4mm; Manufacturer_Part_Number: PLT10HH501100PNL; Mouser Part Number: 81-PLT10HH501100PNL; Mouser Price/Stock: https://www.mouser.co.uk/ProductDetail/Murata-Electronics/PLT10HH501100PNL?qs=UOUhb9503hEfTgGbug4ocA%3D%3D; Arrow Part Number: PLT10HH501100PNL; Arrow Price/Stock: https://www.arrow.com/en/products/plt10hh501100pnl/murata-manufacturing?region=nac
IC1 = AP74700QW6-7: Integrated Circuit; Manufacturer_Name: Diodes Incorporated; Datasheet Link: https://www.diodes.com//assets/Datasheets/AP74700Q.pdf; Height: 1.4mm; Manufacturer_Part_Number: AP74700QW6-7; Mouser Part Number: 621-AP74700QW6-7; Mouser Price/Stock: https://www.mouser.co.uk/ProductDetail/Diodes-Incorporated/AP74700QW6-7?qs=vvQtp7zwQdPsSFAXTBJZqQ%3D%3D; Arrow Part Number: AP74700QW6-7; Arrow Price/Stock: https://www.arrow.com/en/products/ap74700qw6-7/diodes-incorporated?utm_currency=USD&region=europe
L1 = PA4343.103NLT: Inductor; Manufacturer_Name: Yageo Group; Datasheet Link: https://datasheet.datasheetarchive.com/originals/distributors/DKDS-10/182394.pdf; Height: 6.5mm; Manufacturer_Part_Number: PA4343.103NLT; Mouser Part Number: 673-PA4343.103NLT; Mouser Price/Stock: https://www.mouser.co.uk/ProductDetail/Pulse-Electronics/PA4343.103NLT?qs=%2FzQKu7YvIMb8arzTB%2FvZ4w%3D%3D; Arrow Part Number: PA4343.103NLT; Arrow Price/Stock: https://www.arrow.com/en/products/pa4343.103nlt/pulse-electronics-corporation?region=nac
Q1 = BSZ075N08NS5ATMA1: ComponentLink1Description: Mouser; ComponentLink1URL: https://eu.mouser.com/ProductDetail/Infineon-Technologies/BSZ075N08NS5ATMA1?qs=3Bi3m9r5MQbCecwbz%252BCetA%3D%3D; ComponentLink2Description: Octopart; ComponentLink2URL: https://octopart.com/part/infineon/BSZ075N08NS5ATMA1

## Nets that join several sheets
5V: Main (P1.7), Power_Driver (C16.1 IC3.21 IC3.23)
24V: Main (P1.1 P1.2), Power_Driver (R6.1)
DC_LINK: Main (P3.2 P3.4 P4.2 P4.4), Power_Driver (C10.1 C35.1 IC3.35), Power_Mosfet (21 pins), Input_Filter (6 pins)
GND: Main (13 pins), Power_Driver (9 pins), Power_Mosfet (19 pins), Input_Filter (5 pins)
GATE_UH: Power_Driver (IC3.38), Power_Mosfet (R12.1)
GATE_UL: Power_Driver (IC3.39), Power_Mosfet (R22.1)
GATE_VH: Power_Driver (IC3.43), Power_Mosfet (R14.1)
GATE_VL: Power_Driver (IC3.42), Power_Mosfet (R23.1)
GATE_WH: Power_Driver (IC3.48), Power_Mosfet (R15.1)
GATE_WL: Power_Driver (IC3.1), Power_Mosfet (R24.1)
GND_IN: Main (X13.1), Input_Filter (5 pins)
I_D_SPI_MISO: Main (P2.16), Power_Driver (IC3.17)
O_D_EN_GATE: Main (P2.2), Power_Driver (IC3.9)
O_D_PWM_UH: Main (P2.1), Power_Driver (IC3.11)
O_D_PWM_UL: Main (P2.5), Power_Driver (IC3.12)
O_D_PWM_VH: Main (P2.7), Power_Driver (IC3.13)
O_D_PWM_VL: Main (P2.9), Power_Driver (IC3.14)
O_D_PWM_WH: Main (P2.11), Power_Driver (IC3.15)
O_D_PWM_WL: Main (P2.15), Power_Driver (IC3.16)
O_D_SPI_CLK: Main (P2.8), Power_Driver (IC3.19)
O_D_SPI_CS: Main (P2.4), Power_Driver (IC3.20)
O_D_SPI_MOSI: Main (P2.12), Power_Driver (IC3.18)
Ohisje: Main (C12.1 P3.1 R5.2), Input_Filter (C36.1 C41.2)
SH_U: Power_Driver (C9.2 IC3.37), Power_Mosfet (14 pins)
SH_V: Power_Driver (C8.2 IC3.44), Power_Mosfet (14 pins)
SH_W: Power_Driver (C7.2 IC3.47), Power_Mosfet (14 pins)
SL_U: Power_Driver (IC3.40), Power_Mosfet (9 pins)
SL_V: Power_Driver (IC3.41), Power_Mosfet (9 pins)
SL_W: Power_Driver (IC3.2), Power_Mosfet (K1.2)
SN_U: Power_Driver (IC3.4), Power_Mosfet (C4.1 C6.2 R4.1)
SN_V: Power_Driver (IC3.6), Power_Mosfet (C3.1 C5.2 R3.1)
SO_U: Main (P1.4), Power_Driver (IC3.26)
SO_V: Main (P1.8), Power_Driver (IC3.25)
SP_U: Power_Driver (IC3.3), Power_Mosfet (C2.1 C4.2 R2.1)
SP_V: Power_Driver (IC3.5), Power_Mosfet (C1.1 C3.2 R1.1)
V_BAT_PLUS: Main (X12.1), Input_Filter (9 pins)